# Altium schematic sheet IDC_Tester_v1_LED_5.SchDoc
size 420 x 297 mm; SheetNumber: 8; SheetTotal: 10
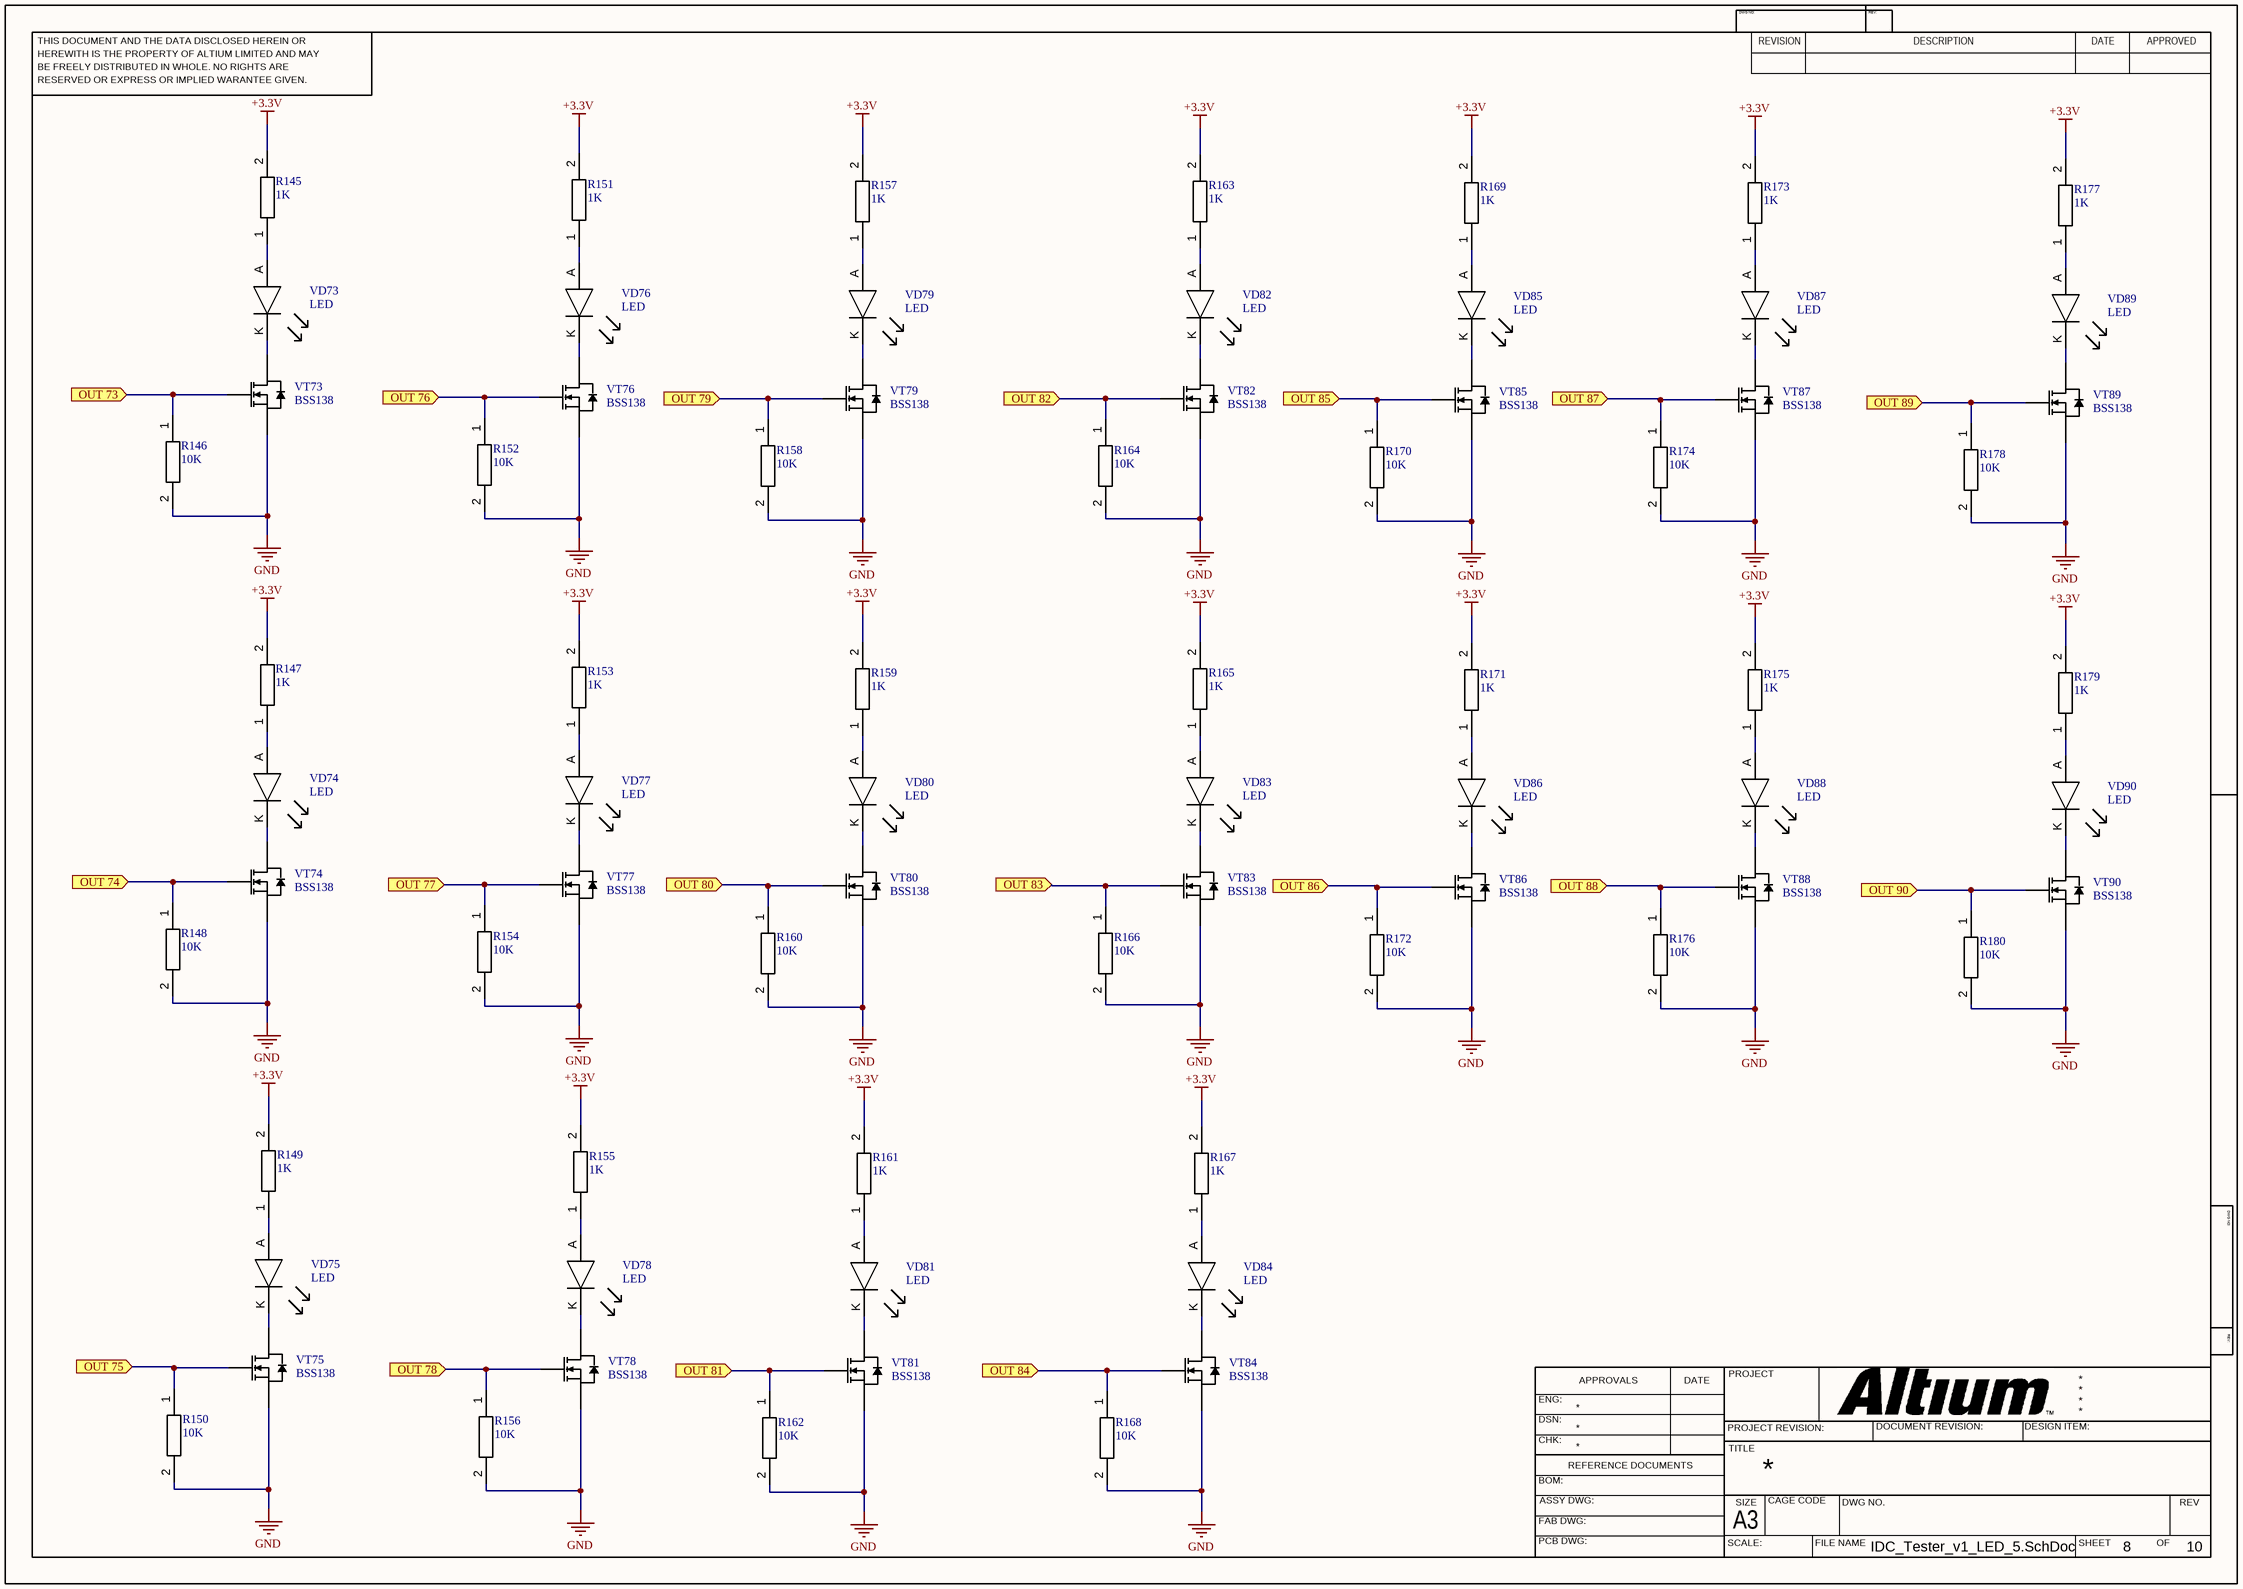
[diagram p0: IDC_Tester_v1_LED_5.SchDoc]

## Parts
R145  1K  [Resistor 0603]
R146  10K  [Resistor 0603]
R147  1K  [Resistor 0603]
R148  10K  [Resistor 0603]
R149  1K  [Resistor 0603]
R150  10K  [Resistor 0603]
R151  1K  [Resistor 0603]
R152  10K  [Resistor 0603]
R153  1K  [Resistor 0603]
R154  10K  [Resistor 0603]
R155  1K  [Resistor 0603]
R156  10K  [Resistor 0603]
R157  1K  [Resistor 0603]
R158  10K  [Resistor 0603]
R159  1K  [Resistor 0603]
R160  10K  [Resistor 0603]
R161  1K  [Resistor 0603]
R162  10K  [Resistor 0603]
R163  1K  [Resistor 0603]
R164  10K  [Resistor 0603]
R165  1K  [Resistor 0603]
R166  10K  [Resistor 0603]
R167  1K  [Resistor 0603]
R168  10K  [Resistor 0603]
R169  1K  [Resistor 0603]
R170  10K  [Resistor 0603]
R171  1K  [Resistor 0603]
R172  10K  [Resistor 0603]
R173  1K  [Resistor 0603]
R174  10K  [Resistor 0603]
R175  1K  [Resistor 0603]
R176  10K  [Resistor 0603]
R177  1K  [Resistor 0603]
R178  10K  [Resistor 0603]
R179  1K  [Resistor 0603]
R180  10K  [Resistor 0603]
VD73  LED  [Led 0603 - duplicate]
VD74  LED  [Led 0603 - duplicate]
VD75  LED  [Led 0603 - duplicate]
VD76  LED  [Led 0603 - duplicate]
VD77  LED  [Led 0603 - duplicate]
VD78  LED  [Led 0603 - duplicate]
VD79  LED  [Led 0603 - duplicate]
VD80  LED  [Led 0603 - duplicate]
VD81  LED  [Led 0603 - duplicate]
VD82  LED  [Led 0603 - duplicate]
VD83  LED  [Led 0603 - duplicate]
VD84  LED  [Led 0603 - duplicate]
VD85  LED  [Led 0603 - duplicate]
VD86  LED  [Led 0603 - duplicate]
VD87  LED  [Led 0603 - duplicate]
VD88  LED  [Led 0603 - duplicate]
VD89  LED  [Led 0603 - duplicate]
VD90  LED  [Led 0603 - duplicate]
VT73  BSS138  [SOT-23-3]
VT74  BSS138  [SOT-23-3]
VT75  BSS138  [SOT-23-3]
VT76  BSS138  [SOT-23-3]
VT77  BSS138  [SOT-23-3]
VT78  BSS138  [SOT-23-3]
VT79  BSS138  [SOT-23-3]
VT80  BSS138  [SOT-23-3]
VT81  BSS138  [SOT-23-3]
VT82  BSS138  [SOT-23-3]
VT83  BSS138  [SOT-23-3]
VT84  BSS138  [SOT-23-3]
VT85  BSS138  [SOT-23-3]
VT86  BSS138  [SOT-23-3]
VT87  BSS138  [SOT-23-3]
VT88  BSS138  [SOT-23-3]
VT89  BSS138  [SOT-23-3]
VT90  BSS138  [SOT-23-3]

## Ports
OUT 73 (in), OUT 74 (in), OUT 75 (in), OUT 76 (in), OUT 77 (in), OUT 78 (in), OUT 79 (in), OUT 80 (in), OUT 81 (in), OUT 82 (in), OUT 83 (in), OUT 84 (in), OUT 85 (in), OUT 86 (in), OUT 87 (in), OUT 88 (in), OUT 89 (in), OUT 90 (in)

## Nets
+3.3V: R145.2 R147.2 R149.2 R151.2 R153.2 R155.2 R157.2 R159.2 R161.2 R163.2 R165.2 R167.2 R169.2 R171.2 R173.2 R175.2 R177.2 R179.2
GND: R146.2 R148.2 R150.2 R152.2 R154.2 R156.2 R158.2 R160.2 R162.2 R164.2 R166.2 R168.2 R170.2 R172.2 R174.2 R176.2 R178.2 R180.2 VT73.2(S) VT74.2(S) VT75.2(S) VT76.2(S) VT77.2(S) VT78.2(S) VT79.2(S) VT80.2(S) VT81.2(S) VT82.2(S) VT83.2(S) VT84.2(S) VT85.2(S) VT86.2(S) VT87.2(S) VT88.2(S) VT89.2(S) VT90.2(S)
OUT 73: R146.1 VT73.1(G) ; port OUT 73
OUT 74: R148.1 VT74.1(G) ; port OUT 74
OUT 75: R150.1 VT75.1(G) ; port OUT 75
OUT 76: R152.1 VT76.1(G) ; port OUT 76
OUT 77: R154.1 VT77.1(G) ; port OUT 77
OUT 78: R156.1 VT78.1(G) ; port OUT 78
OUT 79: R158.1 VT79.1(G) ; port OUT 79
OUT 80: R160.1 VT80.1(G) ; port OUT 80
OUT 81: R162.1 VT81.1(G) ; port OUT 81
OUT 82: R164.1 VT82.1(G) ; port OUT 82
OUT 83: R166.1 VT83.1(G) ; port OUT 83
OUT 84: R168.1 VT84.1(G) ; port OUT 84
OUT 85: R170.1 VT85.1(G) ; port OUT 85
OUT 86: R172.1 VT86.1(G) ; port OUT 86
OUT 87: R174.1 VT87.1(G) ; port OUT 87
OUT 88: R176.1 VT88.1(G) ; port OUT 88
OUT 89: R178.1 VT89.1(G) ; port OUT 89
OUT 90: R180.1 VT90.1(G) ; port OUT 90
NetR145_1: R145.1 VD73.A
NetR147_1: R147.1 VD74.A
NetR149_1: R149.1 VD75.A
NetR151_1: R151.1 VD76.A
NetR153_1: R153.1 VD77.A
NetR155_1: R155.1 VD78.A
NetR157_1: R157.1 VD79.A
NetR159_1: R159.1 VD80.A
NetR161_1: R161.1 VD81.A
NetR163_1: R163.1 VD82.A
NetR165_1: R165.1 VD83.A
NetR167_1: R167.1 VD84.A
NetR169_1: R169.1 VD85.A
NetR171_1: R171.1 VD86.A
NetR173_1: R173.1 VD87.A
NetR175_1: R175.1 VD88.A
NetR177_1: R177.1 VD89.A
NetR179_1: R179.1 VD90.A
NetVD73_K: VD73.K VT73.3(D)
NetVD74_K: VD74.K VT74.3(D)
NetVD75_K: VD75.K VT75.3(D)
NetVD76_K: VD76.K VT76.3(D)
NetVD77_K: VD77.K VT77.3(D)
NetVD78_K: VD78.K VT78.3(D)
NetVD79_K: VD79.K VT79.3(D)
NetVD80_K: VD80.K VT80.3(D)
NetVD81_K: VD81.K VT81.3(D)
NetVD82_K: VD82.K VT82.3(D)
NetVD83_K: VD83.K VT83.3(D)
NetVD84_K: VD84.K VT84.3(D)
NetVD85_K: VD85.K VT85.3(D)
NetVD86_K: VD86.K VT86.3(D)
NetVD87_K: VD87.K VT87.3(D)
NetVD88_K: VD88.K VT88.3(D)
NetVD89_K: VD89.K VT89.3(D)
NetVD90_K: VD90.K VT90.3(D)

## Notes on the sheet
- THIS DOCUMENT AND THE DATA DISCLOSED HEREIN OR
- HEREWITH IS THE PROPERTY OF ALTIUM LIMITED AND MAY
- DWG NO:
- REVISION
- REV:
- DESCRIPTION
- DATE
- APPROVED
- BE FREELY DISTRIBUTED IN WHOLE. NO RIGHTS ARE
- RESERVED OR EXPRESS OR IMPLIED WARANTEE GIVEN.
- ENG:
- APPROVALS
- PROJECT
- DSN:
- CHK:
- REFERENCE DOCUMENTS
- PROJECT REVISION:
- TITLE
- DOCUMENT REVISION:
- DESIGN ITEM:
- BOM:
- FAB DWG:
- PCB DWG:
- ASSY DWG:
- SCALE:
- A3
- SIZE
- CAGE CODE
- FILE NAME
- DWG NO.
- SHEET
- OF
- REV

## Library data of the parts
R145 R147 R149 R151 R153 R155 R157 R159 R161 R163 R165 R167 R169 R171 R173 R175 R177 R179 = Resistor 1K: Part Number: SMD RES 1K OHM 1%±100ppm/°C 0603 (RMCF0603FT1K00); Added by: viskov2055@gmail.com; Mount_Type: SMD; Solder_Amount: 2; Pkg: 0603; Created at: 13/02/2024; Mount: MOUNT
R146 R148 R150 R152 R154 R156 R158 R160 R162 R164 R166 R168 R170 R172 R174 R176 R178 R180 = Resistor 10K: Part Number: SMD RES 10K OHM 1%±100ppm/°C 0603 (RMCF0603FT10K0); Added by: viskov2055@gmail.com; Mount_Type: SMD; Solder_Amount: 2; Pkg: 0603; Created at: 15/02/2024; Mount: MOUNT
VD73-VD90 = LED: LED Uni-Color Green 515nm 2-Pin SMD T/R; Manufacturer: Kingbright; Manufacturer Part Number: APG1608ZGCK; Lens Style: Flat; Lens Transparency: Clear; Luminous Intensity: 400mcd; Forward Voltage: 3.3V; Test Current: 20mA; Viewing Angle: 130°; Dominant Wavelength: 525nm; Lens Size: 0.8mm; Added by: viskov2055@gmail.com; Solder_Amount: 2; Pkg: 0603; RoHS: Yes; Category: LEDs; Stock 1: 44996; Pricing 1: 1=0,6, 10=0,368, 100=0,2114, 1000=0,16544, 2000=0,15165 (USD); MountType: SMD; Case/Package: 0603; Color: Green; Case Code (Imperial): 0603; Case Code (Metric): 1608; Packaging: Tape and Reel; Length: 1.6mm; Width: 0.8mm; Height: 0.28mm; RoHS Compliant: Yes; ComponentLink1URL: https://datasheet.octopart.com/APG1608ZGCK-Kingbright-datasheet-153682089.pdf?src-supplier=Future+Electronics; ComponentLink1Description: https://datasheet.octopart.com/APG1608ZGCK-Kingbright-datasheet-153682089.pdf?src-supplier=Future+Electronics; ComponentLink2URL: http://www.kingbrightusa.com/images/catalog/SPEC/APG1608ZGCK.pdf?src-supplier=Digikey; ComponentLink2Description: http://www.kingbrightusa.com/images/catalog/SPEC/APG1608ZGCK.pdf?src-supplier=Digikey; ComponentLink3URL: https://datasheet.octopart.com/APG1608ZGCK-Kingbright-datasheet-137408059.pdf?src-supplier=Sager+Electronics; ComponentLink3Description: https://datasheet.octopart.com/APG1608ZGCK-Kingbright-datasheet-137408059.pdf?src-supplier=Sager+Electronics; Supplier Part Number 1: 754-2113-1-ND; Created at: 13/02/2024; Mount: MOUNT; Part Number: APG1608ZGCK; Supplier 1: Digikey
VT73-VT90 = BSS138: N-Channel Logic Level Enhancement Mode Field Effect Transistor; Solder_Amount: 3; Added_by: ma_lubushkin@teslatec.ru; Pkg: SOT-23; Part Number: BSS138; Mount: MOUNT; MountType: SMD; Created_at: 03/12/2019